# Altium project Cyborg greenC_Debug.PrjPCB
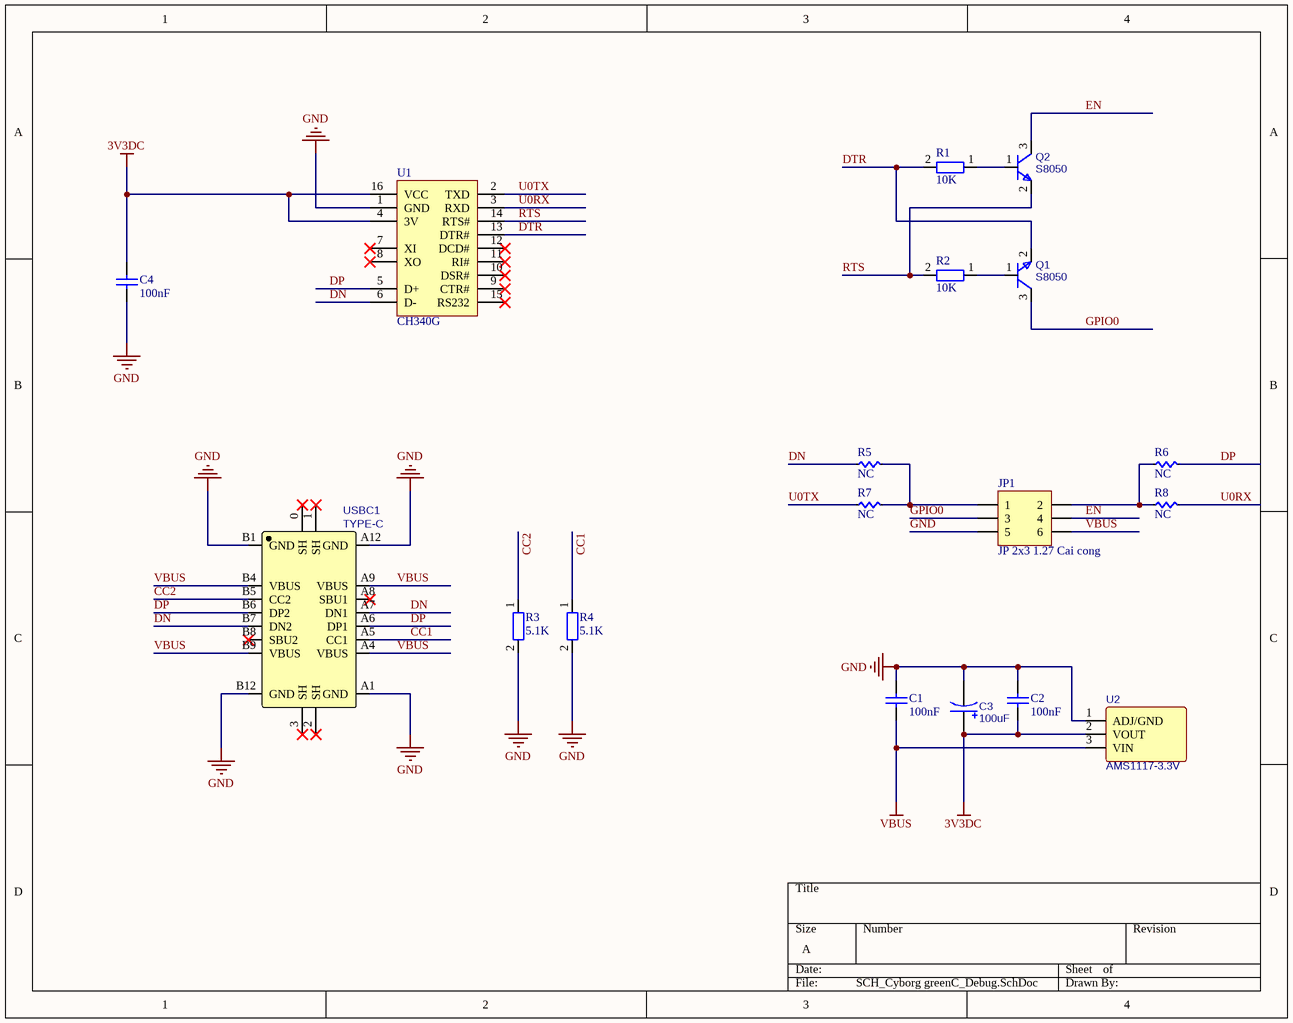
[diagram p0: SCH_Cyborg greenC_Debug.SchDoc]
1 sheet, 18 parts. Net scope: global (net labels, ports and power ports of the same name join across sheets).
Board files: PCB_Cyborg greenC_Debug.PcbDoc, PCB_Panel_Cyborg debug.PcbDoc

## Sheet SCH_Cyborg greenC_Debug.SchDoc
size A

### Parts
C1  100nF  [CAP CERAMIC SMD 0805 TyPE 2012]
C2  100nF  [CAP CERAMIC SMD 0805 TyPE 2012]
C3  100uF  [CAP TANTALUM SMD 3528-21 type B]
C4  100nF  [CAP CERAMIC SMD 0805 TyPE 2012]
JP1  JP 2x3 1.27 Cai cong  [JP 2X3 CT 1.27]
Q1  S8050  [SOT-23]
Q2  S8050  [SOT-23]
R1  10K  [Res CHIPS SMD 0603 TYPE 1608]
R2  10K  [Res CHIPS SMD 0603 TYPE 1608]
R3  5.1K  [RES CHIPS SMD 0805 TYPE 2012]
R4  5.1K  [RES CHIPS SMD 0805 TYPE 2012]
R5  NC  [R0402]
R6  NC  [R0402]
R7  NC  [R0402]
R8  NC  [R0402]
U1  CH340G  [SOP-16]
U2  AMS1117-3.3V  [SOT-89]
USBC1  TYPE-C  [CONNECTORS SMD USB TYPE C 16P]

### Nets
3V3DC: C2.1 C3.1 C4.2 U1.4(3V) U1.16(VCC) U2.2(VOUT)
GND: C1.2 C2.2 C3.2 C4.1 JP1.5 R3.2 R4.2 U1.1(GND) U2.1(ADJ/GND) USBC1.A1(GND) USBC1.A12(GND) USBC1.B1(GND) USBC1.B12(GND)
VBUS: C1.1 JP1.6 U2.3(VIN) USBC1.A4(VBUS) USBC1.A9(VBUS) USBC1.B4(VBUS) USBC1.B9(VBUS)
CC1: R4.1 USBC1.A5(CC1)
CC2: R3.1 USBC1.B5(CC2)
DN: R5.1 U1.6(D-) USBC1.A7(DN1) USBC1.B7(DN2)
DP: R6.1 U1.5(D+) USBC1.A6(DP1) USBC1.B6(DP2)
DTR: Q1.2(E) R1.2 U1.13(DTR#)
EN: JP1.4 Q2.3(C)
GPIO0: JP1.3 Q1.3(C)
RTS: Q2.2(E) R2.2 U1.14(RTS#)
U0RX: R8.1 U1.3(RXD)
U0TX: R7.1 U1.2(TXD)
NetJP1_1: JP1.1 R5.2 R7.2
NetJP1_2: JP1.2 R6.2 R8.2
NetQ1_1: Q1.1(B) R2.1
NetQ2_1: Q2.1(B) R1.1

Not connected (* = marked no-connect by the designer): U1 7(XI)* 8(XO)* 9(CTR#)* 10(DSR#)* 11(RI#)* 12(DCD#)* 15(RS232)*; USBC1 0(SH)* 1(SH)* 2(SH)* 3(SH)* A8(SBU1)* B8(SBU2)*

### Library data of the parts
C1 C2 C4 = CAP 0805 50V 10%: 0805 Multilayer Ceramic Capacitors MLCC - SMD/SMT ROHS
C3 = CAP ALU HOLD: Aluminum Electrolytic Capacitors - Leaded ROHS; BOM_Manufacturer: AISHI(艾华集团); BOM_Manufacturer Part: ERR1VM102G20OT; nameAlias: Capacitance; Contributor: LCSC; BOM_Supplier: LCSC; BOM_Supplier Part: C398835; BOM_JLCPCB Part Class: Extended Part; spicePre: C; spiceSymbolName: ERR1VM102G20OT
JP1 = JP 2x3 1.27 Cai Thang
Q1 Q2 = TRANSISTOR SMD NPN: SOT-23 Bipolar Transistors npn - BJT ROHS; BOM_Manufacturer: 晶扬电子; BOM_Manufacturer Part: MMBT3904; Contributor: lcsc; BOM_Supplier: LCSC; BOM_Supplier Part: C5156716; link: https://atta.szlcsc.com/upload/public/pdf/source/20220916/F7F78DEEB551E1B14C8EDDE9CBB3CED9.pdf; spicePre: Q; spiceSymbolName: MMBT3904_C5156716
R1-R4 = RES 0805 1%: ±1% - Chip Resistor - Surface Mount ROHS; Chung_Loai: Dán; So_Chan: 2; Ma_Hang: MH005880; Don_Vi: Con; Kieu_Chan: *
R5-R8 = RES 0402: RES SMD 0402; Manufacturer: Vishay Dale; Manufacturer Part Number: CRCW040210K0FKED; Resistance (Ohms): 10k; Tolerance: ±1%; Power (Watts): 0.063W, 1/16W; Temperature Coefficient: ±100ppm/°C; Supplier 1: Digi-Key; RoHS: RoHS Compliant; Category: Resistors; Stock 1: 2392462; Pricing 1: 10=0.083, 50=0.0444, 200=0.0255, 1000=0.0174 (USD); Packaging: Cut Tape (CT); Composition: Thick Film; Features: Automotive AEC-Q200; Operating Temperature: -55°C ~ 155°C; Package / Case: 0402 (1005 Metric); Supplier Device Package: 0402 (1005 Metric); Size / Dimension: 0.039" L x 0.020" W (1.00mm x 0.50mm); Height: 0.016" (0.40mm); Number of Terminations: 2; ComponentLink1URL: http://www.vishay.com/docs/20035/dcrcwe3.pdf; ComponentLink1Description: http://www.vishay.com/docs/20035/dcrcwe3.pdf; Supplier Part Number 1: 541-10.0KLCT-ND
U1 = IC_CH340G: Transceiver 2Mbps USB 2.0 SOP-16-150mil USB ICs ROHS; Note: Pins 4, 8 and 14 are not connected; Published: 8-Jun-2000; LatestRevisionDate: 04-Mar-2005; LatestRevisionNote: Stylized 3D Model Added.; DatasheetVersion: PD60147J; PackageReference: PDIP14; Publisher: Altium Limited; PackageDescription: DIP; 14 Leads; Row Spacing 7.62 mm; Pitch 2.54 mm; ComponentLink1Description: Manufacturer Link; ComponentLink1URL: http://www.irf.com/; ComponentLink2Description: Datasheet; ComponentLink2URL: http://www.irf.com/product-info/datasheets/data/ir2110.pdf
U2 = POWER CONVERTERS AMS117-3V3 - SOT-89: Manufacturer: Slkor(萨科微); Manufacturer Part: AMS1117-1.8; Contributor: LCSC; JLCPCB Part Class: Extended Part; Supplier: LCSC; Supplier Part: C880751; spicePre: U; spiceSymbolName: AMS1117-1.8_C880751
USBC1 = CONNECTORS TYPE-C-31-M-12: 5A 1 16 Female Type-C SMD USB Connectors ROHS; BOM_Manufacturer: 韩国韩荣; Contributor: LCSC; BOM_Supplier: LCSC; BOM_Supplier Part: C165948; BOM_Manufacturer Part: TYPE-C-31-M-12; BOM_JLCPCB Part Class: Extended Part; spicePre: U; spiceSymbolName: TYPE-C-31-M-12; Supplier 1: Farnell